# EasyEDA Pro project wzh2814685-voltpen_v0-5-3f4d7379.epro, board T65支架_板厚0.8
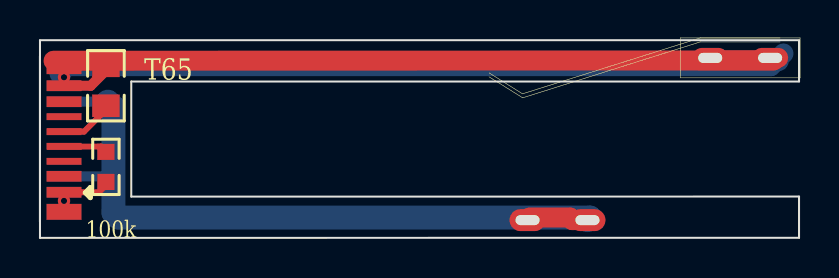
[diagram p9: board, top side]
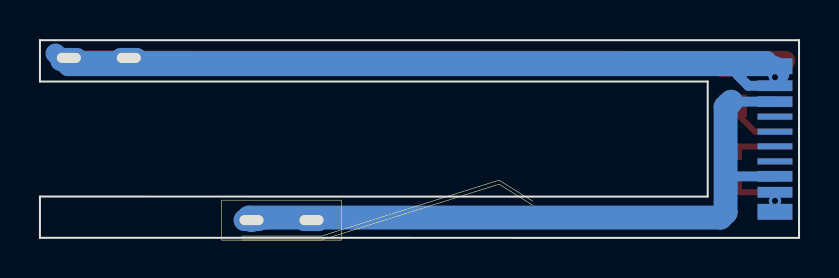
[diagram p10: board, bottom side, seen from below]

Outline 38 x 9.9 mm; copper layers: Top Layer, Bottom Layer. Coordinates in mm from the lower left corner of the outline.
Outline path: 0,9.9 0,0 38,0 38,2.07 4.57,2.07 4.57,7.83 38,7.83 38,9.9 0,9.9
Stack: Top Layer 0.035mm / Dielectric1 1.51mm FR4 er 4.5 / Bottom Layer 0.035mm

## Design rules (mm)
spacing safeClearance (default): track to track 0.152, other pairs 0.152 to 0.3
spacing Plane_innerPlane: track to track 0.152, other pairs 0.152 to 0.3
spacing Copper_copperRegion: track to track 0.152, other pairs 0.152 to 0.3
track width trackWidth (default): min 0.127, default 0.254, max 2.54
differential pair differentialPair (default): width min 0.127, default 0.254, max 2.54; gap min 0.152, default 0.152

## Placement (name value [footprint] x y rotation side)
J13  t12_tanpian  [T12TANPIAN#2]  25.91 0.89 180 bottom
J20  t12_tanpian  [T12TANPIAN]  35.05 9.02 180 top
R1  10kΩ  [R0603]  3.3 3.56 90 top
S1  -  [R0805]  3.3 7.62 270 top
USB4  TYPE-C-16简化 公头  [TYPE-C-16P简化 公头]  0.01 4.95 90 top

## Footprints (pads in the part's own frame, mm; a bottom-side part is the same pattern mirrored in y, then rotated)
R0603
  rect 0.806x0.864 smd: 1(-0.753,0) 2(0.753,0)
R0805
  rect 1.133x1.377 smd: 1(-1,0) 2(1,0)
T12TANPIAN
  oval 1.8x1 hole 1.2x0.5: 1(-1.5,0) 2(1.5,0)
T12TANPIAN#2
  oval 1.8x1.1 hole 1.2x0.5: 1(-1.5,0) 2(1.5,0)
TYPE-C-16P简化 公头
  rect 0.8x1.75 smd: 0(-3.65,-1.2) 0(3.65,-1.2)
  rect 0.8x1.75 smd far side: 0(-3.65,-1.2) 0(3.65,-1.2)
  rect 0.54x1.75 smd: A1(-2.67,-1.2) A4(-1.87,-1.2) A9(1.87,-1.2) A12(2.67,-1.2)
  rect 0.35x1.75 smd: A5(-1.12,-1.2) A6(-0.37,-1.2) A7(0.37,-1.2) A8(1.12,-1.2)
  rect 0.54x1.75 smd far side: B1(2.67,-1.2) B4(1.87,-1.2) B9(-1.87,-1.2) B12(-2.67,-1.2)
  rect 0.3x1.75 smd far side: B5(1.12,-1.2) B6(0.37,-1.2) B7(-0.37,-1.2) B8(-1.12,-1.2)

## Nets
GND: J20.1 J20.2 R1.1 S1.1 USB4.0 USB4.A1 USB4.A12 USB4.B1 USB4.B12
H_ID: R1.2 USB4.A6
H_ID2: USB4.B6
IRON-POWER: J13.1 J13.2
SLP: S1.2 USB4.A7
SLP2: USB4.B7
TEMP: USB4.A4 USB4.A9 USB4.B4 USB4.B9

Pads without a net: USB4 A5 A8 B5 B8

## Via types
v1: diameter 0.62, hole 0.31, Top Layer to Bottom Layer, 2 vias

## Routing (per net, layer and track width the routed paths; a pad name or vN(x,y) marks a point on that pad's centre or on a via; arc(x,y) is an arc through that point)
GND: length 121.8
  Top Layer w0.18: 1.21,2.28 1.21,1.3 ; 1.21,8.6 1.21,7.62
  Top Layer w0.3: 1.52,2.29 2.95,2.29 3.43,2.76
  Top Layer w0.5: 1.5,7.62 2.54,7.62 3.66,8.74
  Top Layer w1: 0.68,8.87 36.72,8.89 33.02,8.89
  Bottom Layer w0.18: 1.21,2.28 1.21,1.3
  Bottom Layer w0.5: 1.5,7.62 2.54,7.62 3.1,8.18
  Bottom Layer w1: USB4.0 36.58,8.6 37.22,9.24 ; 0.98,8.22 1.62,8.86 36.98,8.86
  vias: v1(1.2,8.05) v1(1.2,1.85)
H_ID: length 2.1
  Top Layer w0.3: 1.52,4.57 3.06,4.57 3.43,4.21
IRON-POWER: length 3.1
  Top Layer w1: 24.5,1.02 26.53,1.02 26.65,0.89 27.56,0.89
SLP: length 2.7
  Top Layer w0.3: USB4.A7 2.21,5.32 3.43,6.55
TEMP: length 34.4
  Bottom Layer w0.5: USB4.A9 3.27,6.82 3.3,6.86 ; USB4.A4 3.59,3.08 3.68,3.17
  Bottom Layer w1.2: 3.4,6.82 3.68,6.55 3.68,1.28 3.94,1.02 27.53,1.02 27.41,0.89

## Text on the board
Top Silkscreen Layer: 100k | T65
